# Altium schematic sheet Time_Delay.SchDoc
size A4; Date: *******; ApprovedBy: *******; CheckedBy: None; Author: *******; CompanyName: *******; DrawnBy: Name; Engineer: *******; Organization: *******; Address1: *******; Address2: *******; Address3: *******; Address4: *******; DocumentNumber: Doc Num; Revision: *******; SheetNumber: 4; SheetTotal: 7; CurrentTime: *******; CurrentDate: *******; Time: *******; DocumentFullPathAndName: *******; DocumentName: *******; ModifiedDate: *******; ImagePath: *******; ProjectName: *******; Application_BuildNumber: *******
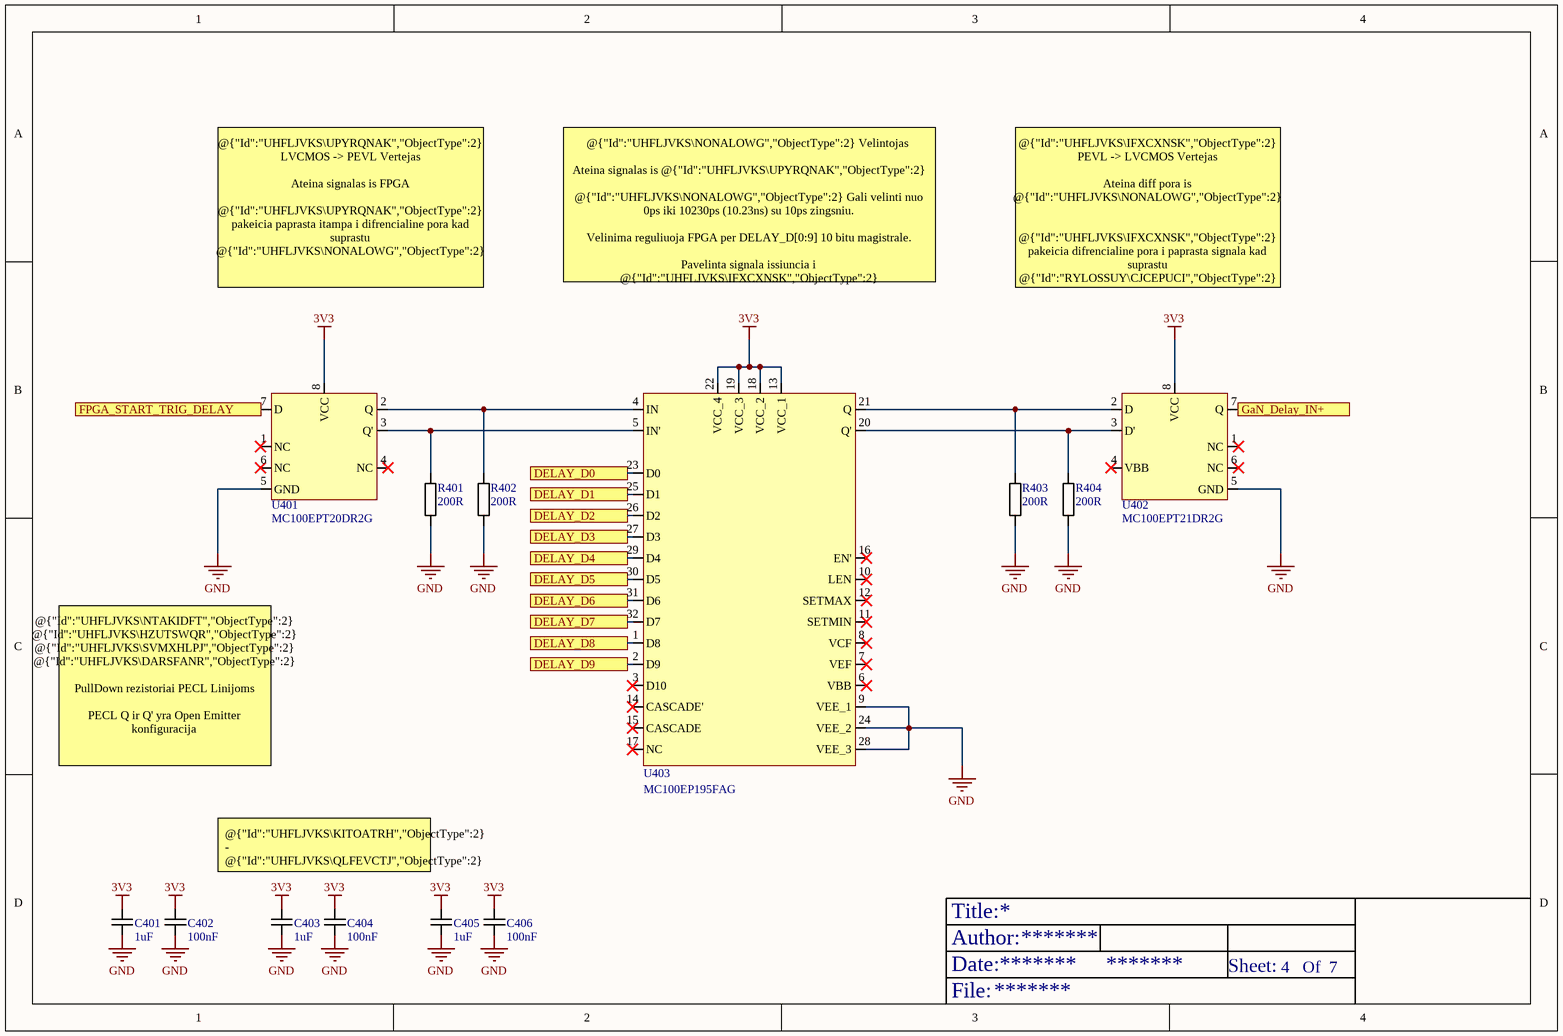
[diagram p0: Time_Delay.SchDoc]

## Parts
C401  1uF  [1uF 0603]
C402  100nF  [100nF 0402]
C403  1uF  [1uF 0603]
C404  100nF  [100nF 0402]
C405  1uF  [1uF 0603]
C406  100nF  [100nF 0402]
R401  200R  [200R 0402]
R402  200R  [200R 0402]
R403  200R  [200R 0402]
R404  200R  [200R 0402]
U401  MC100EPT20DR2G  [MC100EPT20DR2G]
U402  MC100EPT21DR2G  [MC100EPT21DR2G]
U403  MC100EP195FAG  [MC100EP195FAG]

## Ports
DELAY_D0 (see Inputs_Outputs[3B]), DELAY_D1 (see Inputs_Outputs[3B]), DELAY_D2 (see Inputs_Outputs[3B]), DELAY_D3 (see Inputs_Outputs[3B]), DELAY_D4 (see Inputs_Outputs[3B]), DELAY_D5 (see Inputs_Outputs[3B]), DELAY_D6 (see Inputs_Outputs[3B]), DELAY_D7 (see Inputs_Outputs[3B]), DELAY_D8 (see Inputs_Outputs[3B]), DELAY_D9 (see Inputs_Outputs[3B]), FPGA_START_TRIG_DELAY (see Inputs_Outputs[4B]), GaN_Delay_IN+ (see Laser_Driver[1B])

## Nets
3V3: C401.2 C402.2 C403.2 C404.2 C405.2 C406.2 U401.8(VCC) U402.8(VCC) U403.13(VCC_1) U403.18(VCC_2) U403.19(VCC_3) U403.22(VCC_4)
GND: C401.1 C402.1 C403.1 C404.1 C405.1 C406.1 R401.1 R402.1 R403.1 R404.1 U401.5(GND) U402.5(GND) U403.9(VEE_1) U403.24(VEE_2) U403.28(VEE_3)
DELAY_D0: U403.23(D0) ; port DELAY_D0
DELAY_D1: U403.25(D1) ; port DELAY_D1
DELAY_D2: U403.26(D2) ; port DELAY_D2
DELAY_D3: U403.27(D3) ; port DELAY_D3
DELAY_D4: U403.29(D4) ; port DELAY_D4
DELAY_D5: U403.30(D5) ; port DELAY_D5
DELAY_D6: U403.31(D6) ; port DELAY_D6
DELAY_D7: U403.32(D7) ; port DELAY_D7
DELAY_D8: U403.1(D8) ; port DELAY_D8
DELAY_D9: U403.2(D9) ; port DELAY_D9
FPGA_START_TRIG_DELAY: U401.7(D) ; port FPGA_START_TRIG_DELAY
GaN_Delay_IN+: U402.7(Q) ; port GaN_Delay_IN+
NetR401_2: R401.2 U401.3(Q') U403.5(IN')
NetR402_2: R402.2 U401.2(Q) U403.4(IN)
NetR403_2: R403.2 U402.2(D) U403.21(Q)
NetR404_2: R404.2 U402.3(D') U403.20(Q')

Not connected (* = marked no-connect by the designer): U401 1(NC)* 4(NC)* 6(NC)*; U402 1(NC)* 4(VBB)* 6(NC)*; U403 3(D10)* 6(VBB)* 7(VEF)* 8(VCF)* 10(LEN)* 11(SETMIN)* 12(SETMAX)* 14(CASCADE')* 15(CASCADE)* 16(EN')* 17(NC)*

## Notes on the sheet
- @{"Id":"UHFLJVKS\UPYRQNAK","ObjectType":2} LVCMOS -> PEVL Vertejas
  Ateina signalas is FPGA
  @{"Id":"UHFLJVKS\UPYRQNAK","ObjectType":2} pakeicia paprasta itampa i difrencialine pora kad suprastu @{"Id":"UHFLJVKS\NONALOWG","ObjectType":2}
- @{"Id":"UHFLJVKS\NONALOWG","ObjectType":2} Velintojas
  Ateina signalas is @{"Id":"UHFLJVKS\UPYRQNAK","ObjectType":2}
  @{"Id":"UHFLJVKS\NONALOWG","ObjectType":2} Gali velinti nuo 0ps iki 10230ps (10.23ns) su 10ps zingsniu.
  Velinima reguliuoja FPGA per DELAY_D[0:9] 10 bitu magistrale.
  Pavelinta signala issiuncia i @{"Id":"UHFLJVKS\IFXCXNSK","ObjectType":2}
- @{"Id":"UHFLJVKS\IFXCXNSK","ObjectType":2} PEVL -> LVCMOS Vertejas
  Ateina diff pora is @{"Id":"UHFLJVKS\NONALOWG","ObjectType":2}
  @{"Id":"UHFLJVKS\IFXCXNSK","ObjectType":2} pakeicia difrencialine pora i paprasta signala kad suprastu @{"Id":"RYLOSSUY\CJCEPUCI","ObjectType":2}
- @{"Id":"UHFLJVKS\NTAKIDFT","ObjectType":2} @{"Id":"UHFLJVKS\HZUTSWQR","ObjectType":2} @{"Id":"UHFLJVKS\SVMXHLPJ","ObjectType":2} @{"Id":"UHFLJVKS\DARSFANR","ObjectType":2}
  PullDown rezistoriai PECL Linijoms
  PECL Q ir Q' yra Open Emitter konfiguracija
- @{"Id":"UHFLJVKS\KITOATRH","ObjectType":2} - @{"Id":"UHFLJVKS\QLFEVCTJ","ObjectType":2}
  Bus prie @{"Id":"UHFLJVKS\UPYRQNAK","ObjectType":2} - @{"Id":"UHFLJVKS\NONALOWG","ObjectType":2} Iejimu
- Title:
- Date:
- Author:
- Sheet:
- Of
- File:

## Library data of the parts
C401 C403 C405 = 1uF 0603: CGA3E1X7R1E105K080AC
C402 C404 C406 = 100n 0402: C1005X7R1E104K050BB
R401-R404 = 200R 0402: ERA-2AED201X